# Altium schematic sheet SparkAndFuel.SchDoc: Injeção e ignição
size 420 x 297 mm; Author: Matheus Markies; DrawnBy: Matheus Markies; Engineer: Matheus Markies; DocumentNumber: ECTU-SCH-04; Revision: A definir; SheetNumber: 4; SheetTotal: 12; ProjectTitle: ROUTE ECU / ECTU; DocumentStatus: Em desenvolvimento; DocumentDate: 14/10/2026
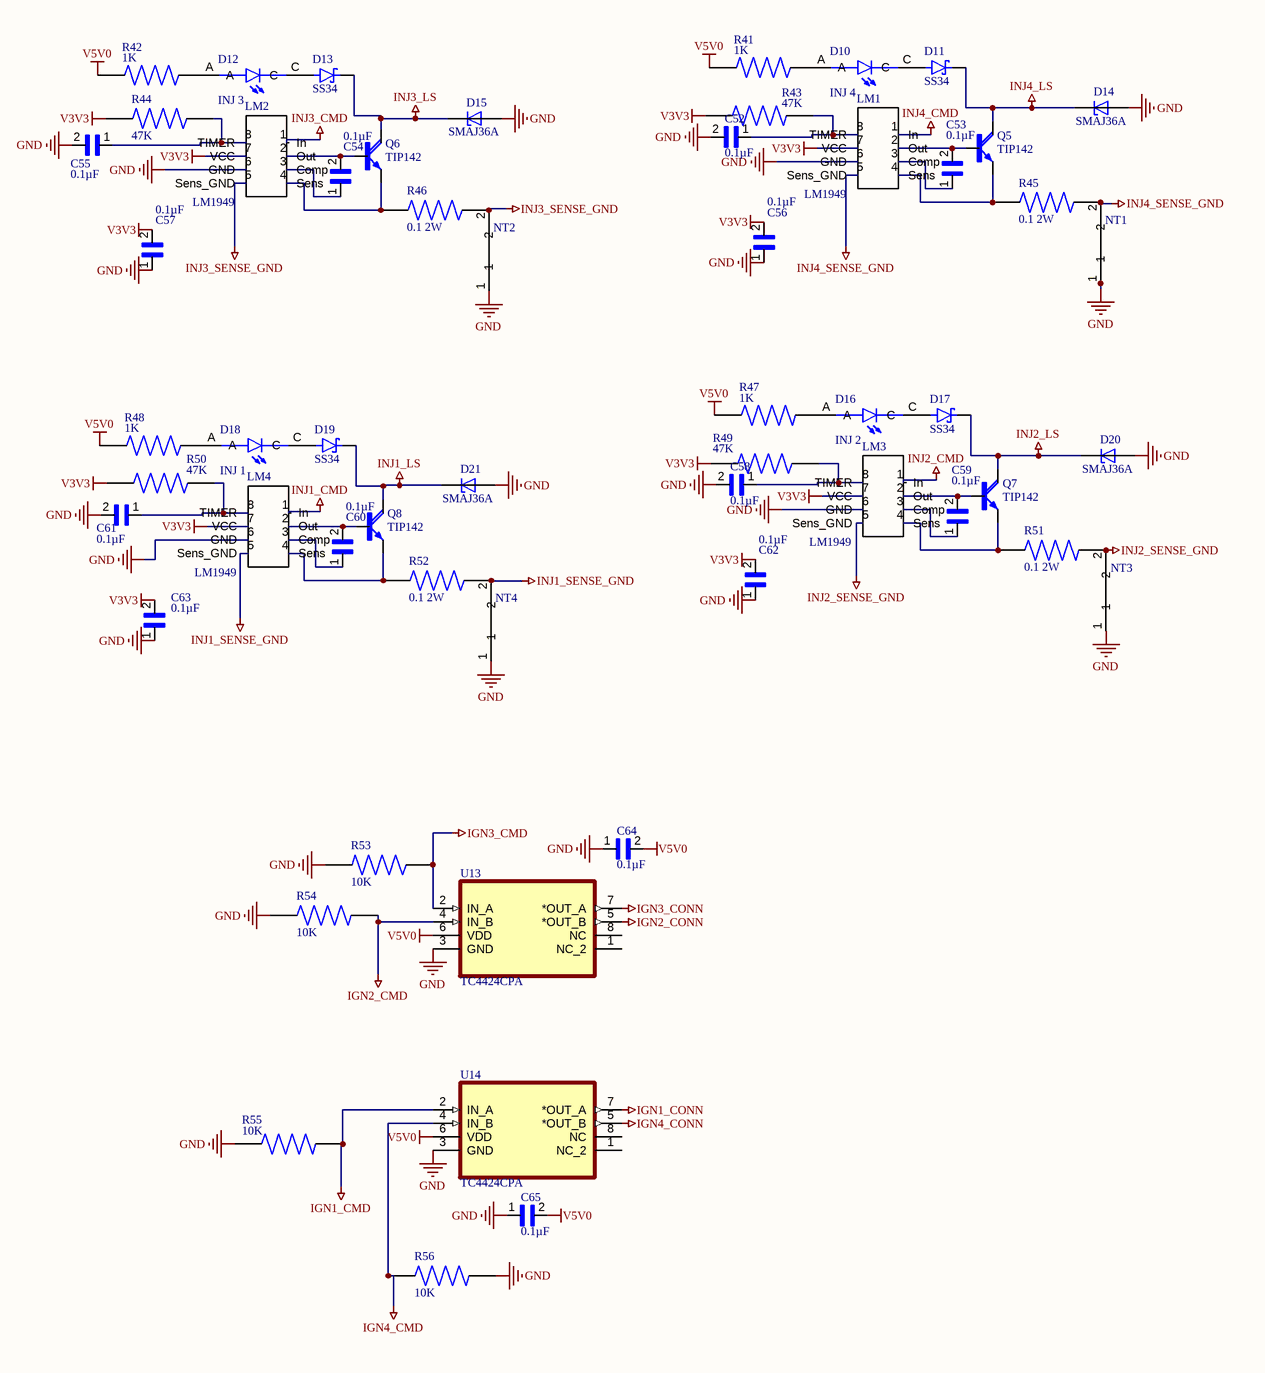
[diagram p0: SparkAndFuel.SchDoc]

## Parts
C52  0.1µF  [CAPC1608X90N]
C53  0.1µF  [CAPC1608X90N]
C54  0.1µF  [CAPC1608X90N]
C55  0.1µF  [CAPC1608X90N]
C56  0.1µF  [CAPC1608X90N]
C57  0.1µF  [CAPC1608X90N]
C58  0.1µF  [CAPC1608X90N]
C59  0.1µF  [CAPC1608X90N]
C60  0.1µF  [CAPC1608X90N]
C61  0.1µF  [CAPC1608X90N]
C62  0.1µF  [CAPC1608X90N]
C63  0.1µF  [CAPC1608X90N]
C64  0.1µF  [CAPC1608X90N]
C65  0.1µF  [CAPC1608X90N]
D10  INJ 4  [LEDC2012X70N]
D11  SS34  [DIO_SS34]
D12  INJ 3  [LEDC2012X70N]
D13  SS34  [DIO_SS34]
D14  SMAJ36A  [DIOM4325X250N]
D15  SMAJ36A  [DIOM4325X250N]
D16  INJ 2  [LEDC2012X70N]
D17  SS34  [DIO_SS34]
D18  INJ 1  [LEDC2012X70N]
D19  SS34  [DIO_SS34]
D20  SMAJ36A  [DIOM4325X250N]
D21  SMAJ36A  [DIOM4325X250N]
LM1  LM1949  [DIP794W45P254L959H508Q8]
LM2  LM1949  [DIP794W45P254L959H508Q8]
LM3  LM1949  [DIP794W45P254L959H508Q8]
LM4  LM1949  [DIP794W45P254L959H508Q8]
NT1  (no value)  [NetTie]  (net tie, no BOM)
NT2  (no value)  [NetTie]  (net tie, no BOM)
NT3  (no value)  [NetTie]  (net tie, no BOM)
NT4  (no value)  [NetTie]  (net tie, no BOM)
Q5  TIP142  [SOT93]
Q6  TIP142  [SOT93]
Q7  TIP142  [SOT93]
Q8  TIP142  [SOT93]
R41  1K  [RESC3116X65N]
R42  1K  [RESC3116X65N]
R43  47K  [RESC3116X65N]
R44  47K  [RESC3116X65N]
R45  0.1 2W  [RESC6331X80N]
R46  0.1 2W  [RESC6331X80N]
R47  1K  [RESC3116X65N]
R48  1K  [RESC3116X65N]
R49  47K  [RESC3116X65N]
R50  47K  [RESC3116X65N]
R51  0.1 2W  [RESC6331X80N]
R52  0.1 2W  [RESC6331X80N]
R53  10K  [RESC3116X65N]
R54  10K  [RESC3116X65N]
R55  10K  [RESC3116X65N]
R56  10K  [RESC3116X65N]
U13  TC4424CPA  [DIP254P762X432-8]
U14  TC4424CPA  [DIP254P762X432-8]

## Nets
GND: C52.2 C55.2 C56.1 C57.1 C58.2 C61.2 C62.1 C63.1 C64.1 C65.1 D14.A D15.A D20.A D21.A LM1.6(GND) LM2.6(GND) LM3.6(GND) LM4.6(GND) NT1.1 NT2.1 NT3.1 NT4.1 R53.1 R54.1 R55.1 R56.1 U13.3(GND) U14.3(GND)
IGN1_CMD: R55.2 U14.2(IN_A)
IGN1_CONN: U14.7(*OUT_A)
IGN2_CMD: R54.2 U13.4(IN_B)
IGN2_CONN: U13.5(*OUT_B)
IGN3_CMD: R53.2 U13.2(IN_A)
IGN3_CONN: U13.7(*OUT_A)
IGN4_CMD: R56.2 U14.4(IN_B)
IGN4_CONN: U14.5(*OUT_B)
INJ1_CMD: LM4.1(In)
INJ1_LS: D19.C(K) D21.C Q8.C
INJ1_SENSE_GND: LM4.5(Sens_GND) NT4.2 R52.2
INJ2_CMD: LM3.1(In)
INJ2_LS: D17.C(K) D20.C Q7.C
INJ2_SENSE_GND: LM3.5(Sens_GND) NT3.2 R51.2
INJ3_CMD: LM2.1(In)
INJ3_LS: D13.C(K) D15.C Q6.C
INJ3_SENSE_GND: LM2.5(Sens_GND) NT2.2 R46.1
INJ4_CMD: LM1.1(In)
INJ4_LS: D11.C(K) D14.C Q5.C
INJ4_SENSE_GND: LM1.5(Sens_GND) NT1.2 R45.2
V3V3: C56.2 C57.2 C62.2 C63.2 LM1.7(VCC) LM2.7(VCC) LM3.7(VCC) LM4.7(VCC) R43.1 R44.1 R49.1 R50.1
V5V0: C64.2 C65.2 R41.1 R42.1 R47.1 R48.1 U13.6(VDD) U14.6(VDD)
NetC52_1: C52.1 LM1.8(TIMER) R43.2
NetC53_1: C53.1 LM1.3(Comp)
NetC53_2: C53.2 LM1.2(Out) Q5.B
NetC54_1: C54.1 LM2.3(Comp)
NetC54_2: C54.2 LM2.2(Out) Q6.B
NetC55_1: C55.1 LM2.8(TIMER) R44.2
NetC58_1: C58.1 LM3.8(TIMER) R49.2
NetC59_1: C59.1 LM3.3(Comp)
NetC59_2: C59.2 LM3.2(Out) Q7.B
NetC60_1: C60.1 LM4.3(Comp)
NetC60_2: C60.2 LM4.2(Out) Q8.B
NetC61_1: C61.1 LM4.8(TIMER) R50.2
NetD10_A: D10.A R41.2
NetD10_C: D10.C D11.A
NetD12_A: D12.A R42.2
NetD12_C: D12.C D13.A
NetD16_A: D16.A R47.2
NetD16_C: D16.C D17.A
NetD18_A: D18.A R48.2
NetD18_C: D18.C D19.A
NetLM1_4: LM1.4(Sens) Q5.E R45.1
NetLM2_4: LM2.4(Sens) Q6.E R46.2
NetLM3_4: LM3.4(Sens) Q7.E R51.1
NetLM4_4: LM4.4(Sens) Q8.E R52.1

Not connected (* = marked no-connect by the designer): U13 1(NC_2) 8(NC); U14 1(NC_2) 8(NC)

## Notes on the sheet
- PROJETO
- STATUS
- FOLHA / SUBSISTEMA
- AUTOR
- CÓDIGO DO DESENHO
- ARQUIVO
- ATUALIZAÇÃO
- REVISÃO
- FOLHA
- FORMATO
- A3
- /

## Library data of the parts
C52-C65 = 06035C104MAZ2A: Multilayer Ceramic Capacitors MLCC - SMD/SMT; Package: None; Price: None; Value: *; MP: 06035C104MAZ2A; Availability: Unavailable
D10 D12 D16 D18 = 597-3305-607F: LED Uni-Color Green 4-Pin Chip 0805 T/R; Availability: Unavailable; Value: *; Price: None; MP: 597-3305-607F; Package: None
D11 D13 D17 D19 = SS34: 3A, 40V, Schottky Rectifier; MF: Taiwan Semiconductor; SnapEDA_Link: https://www.snapeda.com/parts/SS34/Taiwan+Semiconductor/view-part/?ref=snap; Package: DO-214AB-2 Taiwan Semiconductor; Value: *; MP: SS34; Check_prices: https://www.snapeda.com/parts/SS34/Taiwan+Semiconductor/view-part/?ref=eda
D14 D15 D20 D21 = SMAJ36A: 400W Surface Mount Transient Voltage Supressors | Littelfuse SMAJ36A; SnapEDA_Link: https://www.snapeda.com/parts/SMAJ36A/Littelfuse/view-part/?ref=snap; Package: DO-214 Bourns; Value: *; MF: Littelfuse; MP: SMAJ36A; Check_prices: https://www.snapeda.com/parts/SMAJ36A/Littelfuse/view-part/?ref=eda
LM1-LM4 = Component_1
NT1-NT4 = NT
Q5-Q8 = TIP142: Bipolar (BJT) Transistor NPN - Darlington 100 V 10 A - 125 W Through Hole TO-247-3; MF: ON Semiconductor; SnapEDA_Link: https://www.snapeda.com/parts/TIP142/Onsemi/view-part/?ref=snap; Package: SOT-93-3 ON Semiconductor; Value: *; MP: TIP142; Check_prices: https://www.snapeda.com/parts/TIP142/Onsemi/view-part/?ref=eda
R41 R42 R47 R48 = RC1206JR-071KL: RES, THICK FILM, 1K, 5%, 0.25W, 1206; Resistance:1kohm; Resistance Tolerance:Â± 5%; Power Rating:250mW; Resistor Case Style:1206 ^3216 Metric]; Resistor Technology:Thick Film; Resistor Type:General Purpose; Product Range:RC Series; MF: Yageo Corporation; MP: RC1206JR071KL; SnapEDA_Link: https://www.snapeda.com/parts/RC1206JR071KL/Yageo/view-part/?ref=snap; Package: 1206-2 YAGEO; Value: *; Check_prices: https://www.snapeda.com/parts/RC1206JR071KL/Yageo/view-part/?ref=eda
R43 R44 R49 R50 R53-R56 = AA1206JR-07470RL: Package: None; Price: None; Value: *; MP: AA1206JR-07470RL; Availability: Unavailable
R45 R46 R51 R52 = CRM2512-JX-R100ELF: Resistor,Thick Film,Res 0.1 Ohms,Pwr-Rtg 2 W,Tol 5%,SMT,2512 | Bourns CRM2512-JX-R100ELF; SnapEDA_Link: https://www.snapeda.com/parts/CRM2512-JX-R100ELF/Bourns/view-part/?ref=snap; Package: 6331 Bourns; Value: *; MF: Bourns; MP: CRM2512-JX-R100ELF; Check_prices: https://www.snapeda.com/parts/CRM2512-JX-R100ELF/Bourns/view-part/?ref=eda
U13 U14 = TC4424CPA: Dual MOSFET Power Driver 3A 4.5 to 18V Non-Inverting 8-Pin PDIP | Microchip Technology Inc. TC4424CPA; SnapEDA_Link: https://www.snapeda.com/parts/TC4424CPA/Microchip/view-part/?ref=snap; Package: DIP-8 Microchip; Value: *; MF: Microchip; MP: TC4424CPA; Check_prices: https://www.snapeda.com/parts/TC4424CPA/Microchip/view-part/?ref=eda